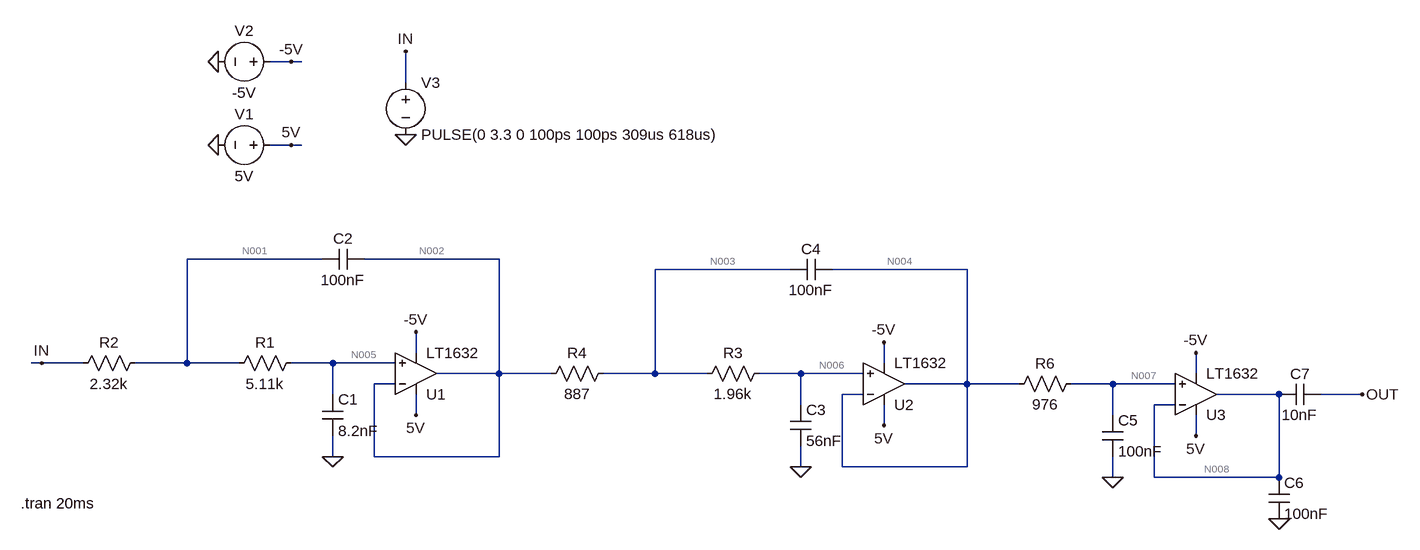
[diagram p0: schematic Draft1.asc]
Draft1.asc, the LTspice schematic file:
Version 4.1
SHEET 1 2616 680
WIRE 848 -1968 816 -1968
WIRE 864 -1968 848 -1968
WIRE 1024 -1936 1024 -1984
WIRE 848 -1840 816 -1840
WIRE 864 -1840 848 -1840
WIRE 896 -1664 688 -1664
WIRE 1168 -1664 960 -1664
WIRE 1616 -1648 1408 -1648
WIRE 1888 -1648 1680 -1648
WIRE 1040 -1520 1040 -1552
WIRE 464 -1504 448 -1504
WIRE 528 -1504 464 -1504
WIRE 688 -1504 688 -1664
WIRE 688 -1504 608 -1504
WIRE 768 -1504 688 -1504
WIRE 912 -1504 848 -1504
WIRE 1008 -1504 912 -1504
WIRE 1760 -1504 1760 -1536
WIRE 1168 -1488 1168 -1664
WIRE 1168 -1488 1072 -1488
WIRE 1248 -1488 1168 -1488
WIRE 1408 -1488 1408 -1648
WIRE 1408 -1488 1328 -1488
WIRE 1488 -1488 1408 -1488
WIRE 1632 -1488 1568 -1488
WIRE 1728 -1488 1632 -1488
WIRE 2240 -1488 2240 -1520
WIRE 1008 -1472 976 -1472
WIRE 1888 -1472 1888 -1648
WIRE 1888 -1472 1792 -1472
WIRE 1968 -1472 1888 -1472
WIRE 2112 -1472 2048 -1472
WIRE 2208 -1472 2112 -1472
WIRE 912 -1456 912 -1504
WIRE 1728 -1456 1696 -1456
WIRE 2368 -1456 2272 -1456
WIRE 2496 -1456 2432 -1456
WIRE 1632 -1440 1632 -1488
WIRE 2208 -1440 2176 -1440
WIRE 1040 -1424 1040 -1456
WIRE 2112 -1424 2112 -1472
WIRE 1760 -1408 1760 -1440
WIRE 2240 -1392 2240 -1424
WIRE 912 -1360 912 -1392
WIRE 976 -1360 976 -1472
WIRE 1168 -1360 1168 -1488
WIRE 1168 -1360 976 -1360
WIRE 1632 -1344 1632 -1376
WIRE 1696 -1344 1696 -1456
WIRE 1888 -1344 1888 -1472
WIRE 1888 -1344 1696 -1344
WIRE 2112 -1328 2112 -1360
WIRE 2176 -1328 2176 -1440
WIRE 2368 -1328 2368 -1456
WIRE 2368 -1328 2176 -1328
FLAG 912 -1360 0
FLAG 464 -1504 IN
FLAG 1040 -1424 5V
FLAG 1040 -1552 -5V
FLAG 1632 -1344 0
FLAG 1760 -1408 5V
FLAG 1760 -1536 -5V
FLAG 2112 -1328 0
FLAG 2240 -1392 5V
FLAG 2240 -1520 -5V
FLAG 2496 -1456 OUT
FLAG 736 -1968 0
FLAG 736 -1840 0
FLAG 848 -1840 5V
FLAG 848 -1968 -5V
FLAG 1024 -1856 0
FLAG 1024 -1984 IN
FLAG 2368 -1264 0
SYMBOL res 864 -1520 R90
WINDOW 0 0 56 VBottom 2
WINDOW 3 32 56 VTop 2
SYMATTR InstName R1
SYMATTR Value 5.11k
SYMBOL cap 896 -1456 R0
SYMATTR InstName C1
SYMATTR Value 8.2nF
SYMBOL res 624 -1520 R90
WINDOW 0 0 56 VBottom 2
WINDOW 3 32 56 VTop 2
SYMATTR InstName R2
SYMATTR Value 2.32k
SYMBOL ADDITIONAL\\sym\\ZZZ\\OpAmps\\LT1632 1040 -1424 M180
SYMATTR InstName U1
SYMBOL cap 960 -1680 R90
WINDOW 0 0 32 VBottom 2
WINDOW 3 32 32 VTop 2
SYMATTR InstName C2
SYMATTR Value 100nF
SYMBOL res 1584 -1504 R90
WINDOW 0 0 56 VBottom 2
WINDOW 3 32 56 VTop 2
SYMATTR InstName R3
SYMATTR Value 1.96k
SYMBOL cap 1616 -1440 R0
SYMATTR InstName C3
SYMATTR Value 56nF
SYMBOL res 1344 -1504 R90
WINDOW 0 0 56 VBottom 2
WINDOW 3 32 56 VTop 2
SYMATTR InstName R4
SYMATTR Value 887
SYMBOL ADDITIONAL\\sym\\ZZZ\\OpAmps\\LT1632 1760 -1408 M180
SYMATTR InstName U2
SYMBOL cap 1680 -1664 R90
WINDOW 0 0 32 VBottom 2
WINDOW 3 32 32 VTop 2
SYMATTR InstName C4
SYMATTR Value 100nF
SYMBOL cap 2096 -1424 R0
SYMATTR InstName C5
SYMATTR Value 100nF
SYMBOL res 2064 -1488 R90
WINDOW 0 0 56 VBottom 2
WINDOW 3 32 56 VTop 2
SYMATTR InstName R6
SYMATTR Value 976
SYMBOL ADDITIONAL\\sym\\ZZZ\\OpAmps\\LT1632 2240 -1392 M180
SYMATTR InstName U3
SYMBOL voltage 832 -1840 R90
WINDOW 0 -32 56 VBottom 2
WINDOW 3 32 56 VTop 2
SYMATTR InstName V1
SYMATTR Value 5V
SYMBOL voltage 832 -1968 R90
WINDOW 0 -32 56 VBottom 2
WINDOW 3 32 56 VTop 2
SYMATTR InstName V2
SYMATTR Value -5V
SYMBOL voltage 1024 -1952 R0
WINDOW 123 0 0 Left 0
WINDOW 39 0 0 Left 0
SYMATTR InstName V3
SYMATTR Value PULSE(0 3.3 0 100ps 100ps 309us 618us)
SYMBOL cap 2352 -1328 R0
SYMATTR InstName C6
SYMATTR Value 100nF
SYMBOL cap 2432 -1472 R90
WINDOW 0 0 32 VBottom 2
WINDOW 3 32 32 VTop 2
SYMATTR InstName C7
SYMATTR Value 10nF
TEXT 432 -1288 Left 2 !.tran 20ms

The netlist it stands for:
* Draft1.asc
R1 N005 N001 5.11k
C1 N005 0 8.2nF
R2 N001 IN 2.32k
X§U1 N005 N002 5V -5V N002 LT1632  ; pins In+ In- V+ V- OUT
C2 N002 N001 100nF
R3 N006 N003 1.96k
C3 N006 0 56nF
R4 N003 N002 887
X§U2 N006 N004 5V -5V N004 LT1632  ; pins In+ In- V+ V- OUT
C4 N004 N003 100nF
C5 N007 0 100nF
R6 N007 N004 976
X§U3 N007 N008 5V -5V N008 LT1632  ; pins In+ In- V+ V- OUT
V1 5V 0 5V
V2 -5V 0 -5V
V3 IN 0 PULSE(0 3.3 0 100ps 100ps 309us 618us)
C6 N008 0 100nF
C7 OUT N008 10nF
.tran 20ms
.lib LTC.lib
.backanno
.end

* Results of the author's LTspice run, read from the files saved beside the schematic
* Operating Point, zero values left out:
*   V(-5v) = -5 V
*   V(5v) = 5 V
*   V(n001) = 2.674 mV
*   V(n002) = 8.566 mV
*   V(n003) = 9.589 mV
*   V(n004) = 11.85 mV
*   V(n005) = 8.565 mV
*   V(n006) = 11.85 mV
*   V(n007) = 12.97 mV
*   V(n008) = 12.98 mV
*   V(out) = 12.98 mV
*   I(R1) = 1.153 µA
*   I(R2) = 1.153 µA
*   I(R3) = 1.153 µA
*   I(R4) = 1.153 µA
*   I(R6) = 1.153 µA
*   I(V1) = -13.17 mA
*   I(V2) = 13.17 mA
*   I(V3) = 1.153 µA
*   Ix(u1:1) = -1.153 µA
*   Ix(u1:2) = -1.153 µA
*   Ix(u1:3) = 4.391 mA
*   Ix(u1:4) = -4.391 mA
*   Ix(u1:5) = 2.305 µA
*   Ix(u2:1) = -1.153 µA
*   Ix(u2:2) = -1.153 µA
*   Ix(u2:3) = 4.391 mA
*   Ix(u2:4) = -4.391 mA
*   Ix(u2:5) = 2.305 µA
*   Ix(u3:1) = -1.153 µA
*   Ix(u3:2) = -1.153 µA
*   Ix(u3:3) = 4.392 mA
*   Ix(u3:4) = -4.391 mA
*   Ix(u3:5) = 1.153 µA